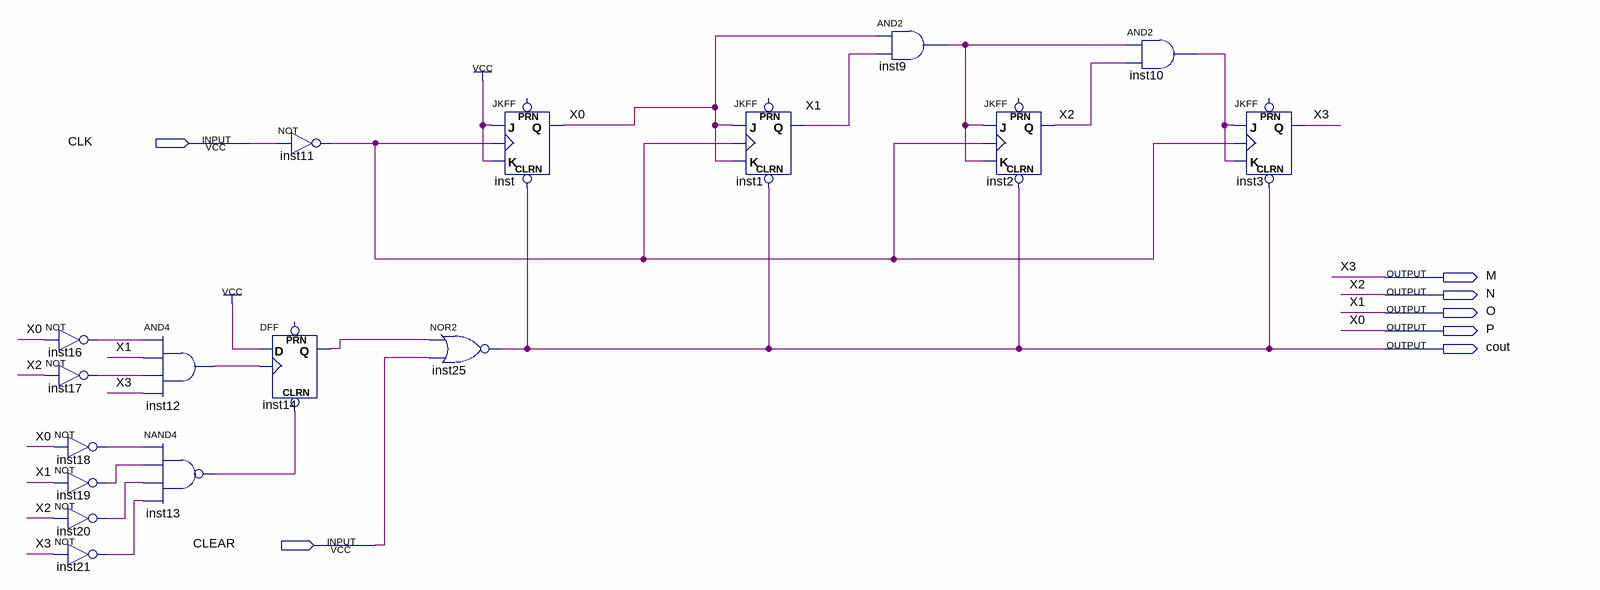
[diagram p0: schematic sheet]
// Quartus schematic Contador9.bdf as structural Verilog: 17 symbols, 7 pins
module Contador9 (
  input  CLK,
  input  CLEAR,
  output M,
  output N,
  output O,
  output P,
  output cout
);

  wire inst9_out, inst10_out, inst11_out, inst12_out, inst13_out, inst14_q, inst16_out, inst17_out,
       inst18_out, inst19_out, inst20_out, inst21_out;

  not inst16 (inst16_out, P);
  not inst17 (inst17_out, N);
  not inst18 (inst18_out, P);
  not inst19 (inst19_out, O);
  not inst20 (inst20_out, N);
  not inst21 (inst21_out, M);
  and inst12 (inst12_out, inst16_out, O, inst17_out, M);
  nand inst13 (inst13_out, inst18_out, inst19_out, inst20_out, inst21_out);
  not inst11 (inst11_out, CLK);
  DFF inst14 (.CLRN(inst13_out), .CLK(inst12_out), .D(1'b1), .Q(inst14_q));  // open: PRN
  nor inst25 (cout, inst14_q, CLEAR);
  JKFF inst (.CLRN(cout), .K(1'b1), .J(1'b1), .CLK(inst11_out), .Q(P));  // open: PRN
  JKFF inst1 (.CLRN(cout), .K(P), .J(P), .CLK(inst11_out), .Q(O));  // open: PRN
  and inst9 (inst9_out, P, O);
  JKFF inst2 (.CLRN(cout), .K(inst9_out), .J(inst9_out), .CLK(inst11_out), .Q(N));  // open: PRN
  and inst10 (inst10_out, inst9_out, N);
  JKFF inst3 (.CLRN(cout), .K(inst10_out), .J(inst10_out), .CLK(inst11_out), .Q(M));  // open: PRN

  // Other names for the same wires on the sheet: X0 = P; X1 = O; X2 = N; X3 = M
endmodule
